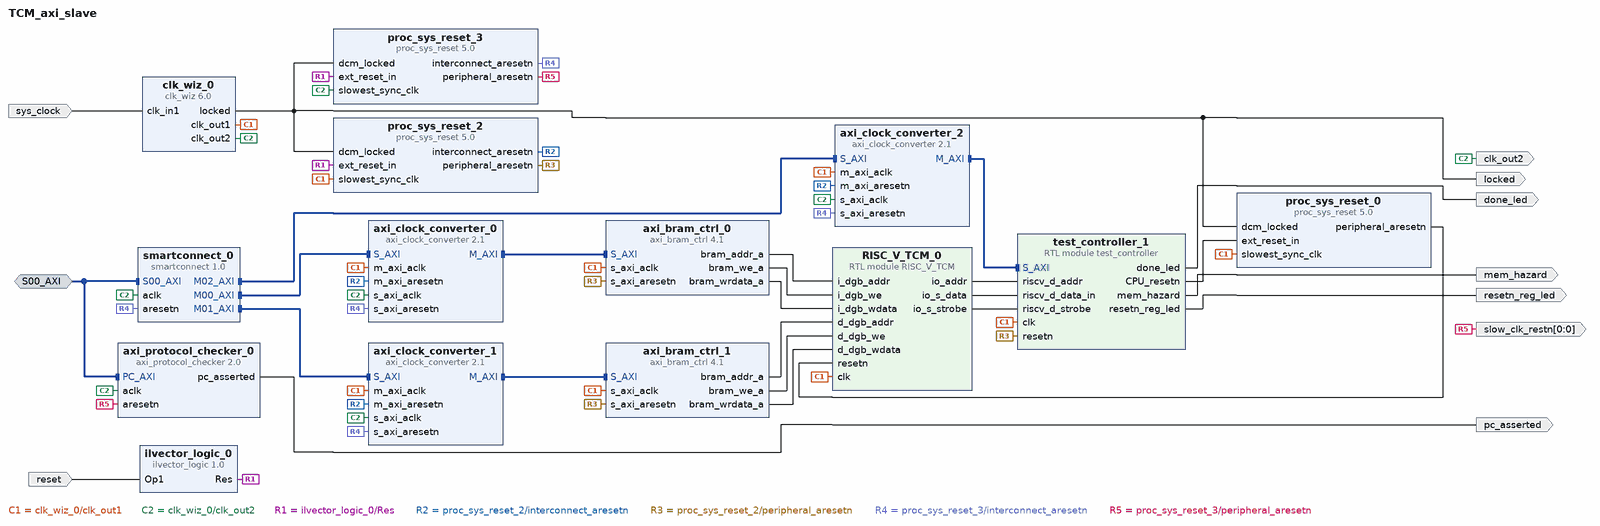
[diagram p0: block diagram of the top level]
# Vivado block design TCM_axi_slave, xc7a100tcsg324-1, Vivado 2026.1
create_bd_design TCM_axi_slave

create_bd_intf_port -mode Slave -vlnv xilinx.com:interface:aximm_rtl:1.0 S00_AXI
set_property -dict [list \
  CONFIG.ADDR_WIDTH 32 \
  CONFIG.ARUSER_WIDTH 0 \
  CONFIG.AWUSER_WIDTH 0 \
  CONFIG.BUSER_WIDTH 0 \
  CONFIG.DATA_WIDTH 32 \
  CONFIG.FREQ_HZ 30000000 \
  CONFIG.HAS_BRESP 1 \
  CONFIG.HAS_BURST 1 \
  CONFIG.HAS_CACHE 1 \
  CONFIG.HAS_LOCK 1 \
  CONFIG.HAS_PROT 1 \
  CONFIG.HAS_QOS 1 \
  CONFIG.HAS_REGION 0 \
  CONFIG.HAS_RRESP 1 \
  CONFIG.HAS_WSTRB 1 \
  CONFIG.ID_WIDTH 1 \
  CONFIG.MAX_BURST_LENGTH 256 \
  CONFIG.NUM_READ_OUTSTANDING 2 \
  CONFIG.NUM_READ_THREADS 1 \
  CONFIG.NUM_WRITE_OUTSTANDING 2 \
  CONFIG.NUM_WRITE_THREADS 1 \
  CONFIG.PROTOCOL AXI4 \
  CONFIG.READ_WRITE_MODE READ_WRITE \
  CONFIG.RUSER_BITS_PER_BYTE 0 \
  CONFIG.RUSER_WIDTH 0 \
  CONFIG.SUPPORTS_NARROW_BURST 1 \
  CONFIG.WUSER_BITS_PER_BYTE 0 \
  CONFIG.WUSER_WIDTH 0 \
] [get_bd_intf_ports S00_AXI]
create_bd_port -dir O -type clk clk_out2
set_property -dict {CONFIG.FREQ_HZ 30000000} [get_bd_ports clk_out2]
create_bd_port -dir O locked
create_bd_port -dir O mem_hazard
create_bd_port -dir I -type rst reset
set_property -dict {CONFIG.POLARITY ACTIVE_HIGH} [get_bd_ports reset]
create_bd_port -dir I -type clk sys_clock
set_property -dict {CONFIG.ASSOCIATED_RESET reset CONFIG.CLK_DOMAIN TCM_sys_clock} [get_bd_ports sys_clock]
create_bd_port -dir O pc_asserted
create_bd_port -dir O -from 0 -to 0 -type rst slow_clk_restn
create_bd_port -dir O resetn_reg_led
create_bd_port -dir O done_led

create_bd_cell -type module -reference RISC_V_TCM RISC_V_TCM_0
create_bd_cell -type ip -vlnv xilinx.com:ip:axi_bram_ctrl:4.1 axi_bram_ctrl_0
set_property -dict {CONFIG.SINGLE_PORT_BRAM 1} [get_bd_cells axi_bram_ctrl_0]
create_bd_cell -type ip -vlnv xilinx.com:ip:axi_bram_ctrl:4.1 axi_bram_ctrl_1
set_property -dict {CONFIG.SINGLE_PORT_BRAM 1} [get_bd_cells axi_bram_ctrl_1]
create_bd_cell -type ip -vlnv xilinx.com:ip:axi_clock_converter:2.1 axi_clock_converter_0
create_bd_cell -type ip -vlnv xilinx.com:ip:axi_clock_converter:2.1 axi_clock_converter_1
create_bd_cell -type ip -vlnv xilinx.com:ip:axi_clock_converter:2.1 axi_clock_converter_2
create_bd_cell -type ip -vlnv xilinx.com:ip:clk_wiz:6.0 clk_wiz_0
set_property -dict [list \
  CONFIG.CLKOUT1_JITTER 227.014 \
  CONFIG.CLKOUT1_PHASE_ERROR 300.046 \
  CONFIG.CLKOUT1_REQUESTED_OUT_FREQ 136 \
  CONFIG.CLKOUT2_JITTER 284.425 \
  CONFIG.CLKOUT2_PHASE_ERROR 300.046 \
  CONFIG.CLKOUT2_REQUESTED_OUT_FREQ 30 \
  CONFIG.CLKOUT2_USED true \
  CONFIG.MMCM_CLKFBOUT_MULT_F 51.000 \
  CONFIG.MMCM_CLKOUT0_DIVIDE_F 7.500 \
  CONFIG.MMCM_CLKOUT1_DIVIDE 34 \
  CONFIG.MMCM_DIVCLK_DIVIDE 5 \
  CONFIG.NUM_OUT_CLKS 2 \
  CONFIG.RESET_PORT reset \
  CONFIG.RESET_TYPE ACTIVE_HIGH \
  CONFIG.USE_RESET false \
] [get_bd_cells clk_wiz_0]
create_bd_cell -type ip -vlnv xilinx.com:ip:proc_sys_reset:5.0 proc_sys_reset_0
create_bd_cell -type ip -vlnv xilinx.com:ip:proc_sys_reset:5.0 proc_sys_reset_2
create_bd_cell -type ip -vlnv xilinx.com:ip:smartconnect:1.0 smartconnect_0
set_property -dict {CONFIG.HAS_ARESETN 1 CONFIG.NUM_MI 3 CONFIG.NUM_SI 1 CONFIG.STRATEGY AUTOMATIC} [get_bd_cells smartconnect_0]
create_bd_cell -type module -reference test_controller test_controller_1
create_bd_cell -type ip -vlnv xilinx.com:ip:axi_protocol_checker:2.0 axi_protocol_checker_0
create_bd_cell -type ip -vlnv xilinx.com:ip:proc_sys_reset:5.0 proc_sys_reset_3
create_bd_cell -type inline_hdl -vlnv xilinx.com:inline_hdl:ilvector_logic:1.0 ilvector_logic_0
set_property -dict {CONFIG.C_OPERATION not CONFIG.C_SIZE 1} [get_bd_cells ilvector_logic_0]

# ---- connections ----

connect_bd_intf_net [get_bd_intf_pins axi_bram_ctrl_0/S_AXI] [get_bd_intf_pins axi_clock_converter_0/M_AXI]
connect_bd_intf_net [get_bd_intf_pins axi_clock_converter_1/M_AXI] [get_bd_intf_pins axi_bram_ctrl_1/S_AXI]
connect_bd_intf_net [get_bd_intf_pins axi_clock_converter_2/M_AXI] [get_bd_intf_pins test_controller_1/S_AXI]
connect_bd_intf_net -intf_net jtag_axi_0_M_AXI [get_bd_intf_ports S00_AXI] [get_bd_intf_pins smartconnect_0/S00_AXI]
connect_bd_intf_net [get_bd_intf_ports S00_AXI] [get_bd_intf_pins axi_protocol_checker_0/PC_AXI]
connect_bd_intf_net [get_bd_intf_pins smartconnect_0/M00_AXI] [get_bd_intf_pins axi_clock_converter_0/S_AXI]
connect_bd_intf_net [get_bd_intf_pins axi_clock_converter_1/S_AXI] [get_bd_intf_pins smartconnect_0/M01_AXI]
connect_bd_intf_net [get_bd_intf_pins axi_clock_converter_2/S_AXI] [get_bd_intf_pins smartconnect_0/M02_AXI]
connect_bd_net [get_bd_pins RISC_V_TCM_0/io_addr] [get_bd_pins test_controller_1/riscv_d_addr]
connect_bd_net [get_bd_pins RISC_V_TCM_0/io_s_data] [get_bd_pins test_controller_1/riscv_d_data_in]
connect_bd_net [get_bd_pins RISC_V_TCM_0/io_s_strobe] [get_bd_pins test_controller_1/riscv_d_strobe]
connect_bd_net [get_bd_pins axi_bram_ctrl_0/bram_addr_a] [get_bd_pins RISC_V_TCM_0/i_dgb_addr]
connect_bd_net [get_bd_pins axi_bram_ctrl_0/bram_we_a] [get_bd_pins RISC_V_TCM_0/i_dgb_we]
connect_bd_net [get_bd_pins axi_bram_ctrl_0/bram_wrdata_a] [get_bd_pins RISC_V_TCM_0/i_dgb_wdata]
connect_bd_net [get_bd_pins axi_bram_ctrl_1/bram_addr_a] [get_bd_pins RISC_V_TCM_0/d_dgb_addr]
connect_bd_net [get_bd_pins axi_bram_ctrl_1/bram_we_a] [get_bd_pins RISC_V_TCM_0/d_dgb_we]
connect_bd_net [get_bd_pins axi_bram_ctrl_1/bram_wrdata_a] [get_bd_pins RISC_V_TCM_0/d_dgb_wdata]
connect_bd_net [get_bd_pins axi_protocol_checker_0/pc_asserted] [get_bd_ports pc_asserted]
connect_bd_net [get_bd_pins clk_wiz_0/clk_out1] \
  [get_bd_pins axi_bram_ctrl_1/s_axi_aclk] [get_bd_pins axi_bram_ctrl_0/s_axi_aclk] \
  [get_bd_pins axi_clock_converter_0/m_axi_aclk] [get_bd_pins axi_clock_converter_1/m_axi_aclk] \
  [get_bd_pins axi_clock_converter_2/m_axi_aclk] [get_bd_pins proc_sys_reset_0/slowest_sync_clk] \
  [get_bd_pins proc_sys_reset_2/slowest_sync_clk] [get_bd_pins test_controller_1/clk] [get_bd_pins RISC_V_TCM_0/clk]
connect_bd_net [get_bd_pins clk_wiz_0/locked] \
  [get_bd_ports locked] [get_bd_pins proc_sys_reset_2/dcm_locked] [get_bd_pins proc_sys_reset_0/dcm_locked] \
  [get_bd_pins proc_sys_reset_3/dcm_locked]
connect_bd_net -net clk_wiz_1_clk_out1 [get_bd_pins clk_wiz_0/clk_out2] \
  [get_bd_ports clk_out2] [get_bd_pins axi_clock_converter_0/s_axi_aclk] [get_bd_pins axi_clock_converter_1/s_axi_aclk] \
  [get_bd_pins axi_clock_converter_2/s_axi_aclk] [get_bd_pins smartconnect_0/aclk] [get_bd_pins axi_protocol_checker_0/aclk] \
  [get_bd_pins proc_sys_reset_3/slowest_sync_clk]
connect_bd_net [get_bd_pins ilvector_logic_0/Res] [get_bd_pins proc_sys_reset_3/ext_reset_in] [get_bd_pins proc_sys_reset_2/ext_reset_in]
connect_bd_net [get_bd_pins proc_sys_reset_0/peripheral_aresetn] [get_bd_pins RISC_V_TCM_0/resetn]
connect_bd_net [get_bd_pins proc_sys_reset_2/interconnect_aresetn] \
  [get_bd_pins axi_clock_converter_2/m_axi_aresetn] [get_bd_pins axi_clock_converter_1/m_axi_aresetn] \
  [get_bd_pins axi_clock_converter_0/m_axi_aresetn]
connect_bd_net [get_bd_pins proc_sys_reset_2/peripheral_aresetn] \
  [get_bd_pins axi_bram_ctrl_1/s_axi_aresetn] [get_bd_pins axi_bram_ctrl_0/s_axi_aresetn] \
  [get_bd_pins test_controller_1/resetn]
connect_bd_net [get_bd_pins proc_sys_reset_3/interconnect_aresetn] \
  [get_bd_pins axi_clock_converter_2/s_axi_aresetn] [get_bd_pins axi_clock_converter_1/s_axi_aresetn] \
  [get_bd_pins axi_clock_converter_0/s_axi_aresetn] [get_bd_pins smartconnect_0/aresetn]
connect_bd_net [get_bd_pins proc_sys_reset_3/peripheral_aresetn] [get_bd_pins axi_protocol_checker_0/aresetn] [get_bd_ports slow_clk_restn]
connect_bd_net [get_bd_ports reset] [get_bd_pins ilvector_logic_0/Op1]
connect_bd_net [get_bd_ports sys_clock] [get_bd_pins clk_wiz_0/clk_in1]
connect_bd_net [get_bd_pins test_controller_1/CPU_resetn] [get_bd_pins proc_sys_reset_0/ext_reset_in]
connect_bd_net [get_bd_pins test_controller_1/done_led] [get_bd_ports done_led]
connect_bd_net [get_bd_pins test_controller_1/mem_hazard] [get_bd_ports mem_hazard]
connect_bd_net [get_bd_pins test_controller_1/resetn_reg_led] [get_bd_ports resetn_reg_led]

# ---- address map ----
assign_bd_address -offset 0x00000000 -range 64K -target_address_space [get_bd_addr_spaces S00_AXI] [get_bd_addr_segs axi_bram_ctrl_0/S_AXI/Mem0]
assign_bd_address -offset 0x80000000 -range 64K -target_address_space [get_bd_addr_spaces S00_AXI] [get_bd_addr_segs axi_bram_ctrl_1/S_AXI/Mem0]
assign_bd_address -offset 0xC0000000 -range 128 -target_address_space [get_bd_addr_spaces S00_AXI] [get_bd_addr_segs test_controller_1/S_AXI/reg0]

validate_bd_design
save_bd_design
